# Altium project MONO65_A2_Project.PrjPcb (part 1 of 2)
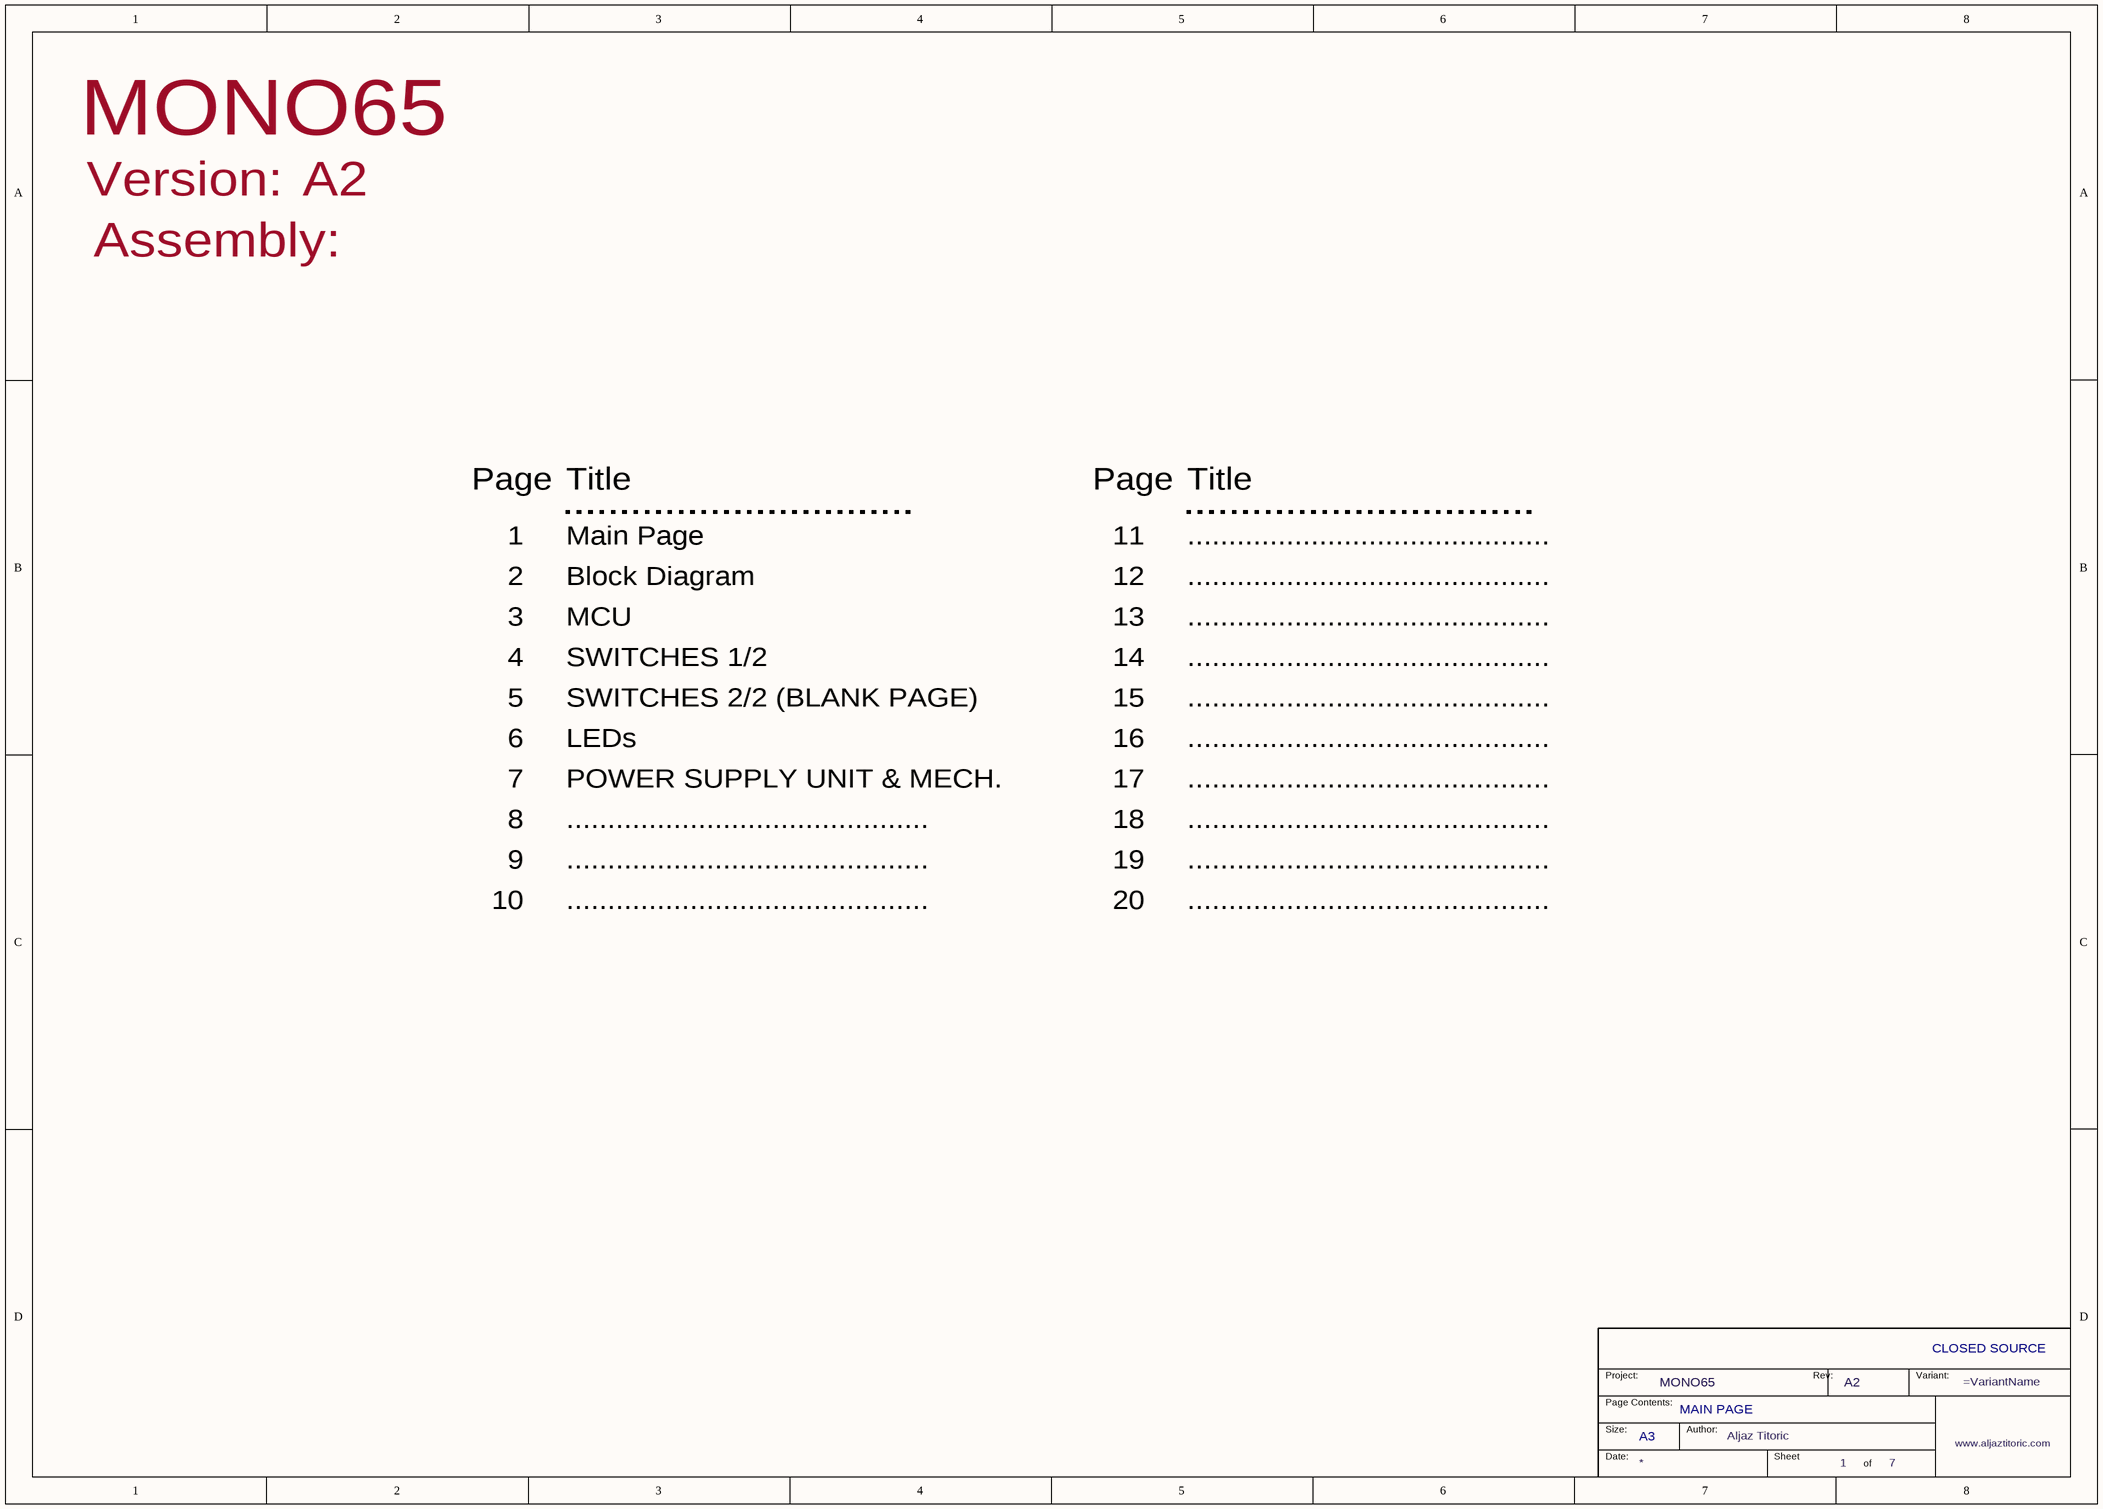
[diagram p0: MONO65_A2_s01 [Main page].SchDoc]
VersionRevision: A2; Project: MONO65; DesignedByURL: www.aljaztitoric.com; DesignedBy: Aljaz Titoric
7 sheets, 281 parts. Net scope: global (net labels, ports and power ports of the same name join across sheets).
Board file: MONO65_A2.PcbDoc
Sheets:
  MONO65_A2_s01 [Main page].SchDoc
  MONO65_A2_s02 [Block diagram].SchDoc
  MONO65_A2_s03 [MCU].SchDoc
  MONO65_A2_s04 [Switches-1].SchDoc
  MONO65_A2_s05 [Switches-2].SchDoc
  MONO65_A2_s06 [LEDs].SchDoc
  MONO65_A2_s07 [PSU].SchDoc

## Sheet MONO65_A2_s01 [Main page].SchDoc
size A3; DocumentNumber: 1; SheetNumber: 1; SheetTotal: 7

### Parts
TB*  PageContents: MAIN PAGE  Licence: CLOSED SOURCE  Size: A3  (hidden comment: TBL TitleBlock 01)  (graphical)

### Notes on the sheet
- Version:
- Assembly:
- Page
- Title
- 1
- 2
- Main Page
- Block Diagram
- 11
- 12
- ............................................
- 3
- MCU
- 13
- 4
- 5
- SWITCHES 1/2
- SWITCHES 2/2 (BLANK PAGE)
- 14
- 15
- 6
- LEDs
- 16
- 7
- 8
- POWER SUPPLY UNIT & MECH.
- 17
- 18
- 9
- 10
- 19
- 20
- (in symbol TBL TitleBlock 01) Project:; Rev:; Variant:; Page Contents:; Size:; Author:; Date:; Sheet; of

### Library data of the parts
TB* = TBL TitleBlock 01: Custom Title block

## Sheet MONO65_A2_s02 [Block diagram].SchDoc
size A3; DocumentNumber: 2; SheetNumber: 2; SheetTotal: 7
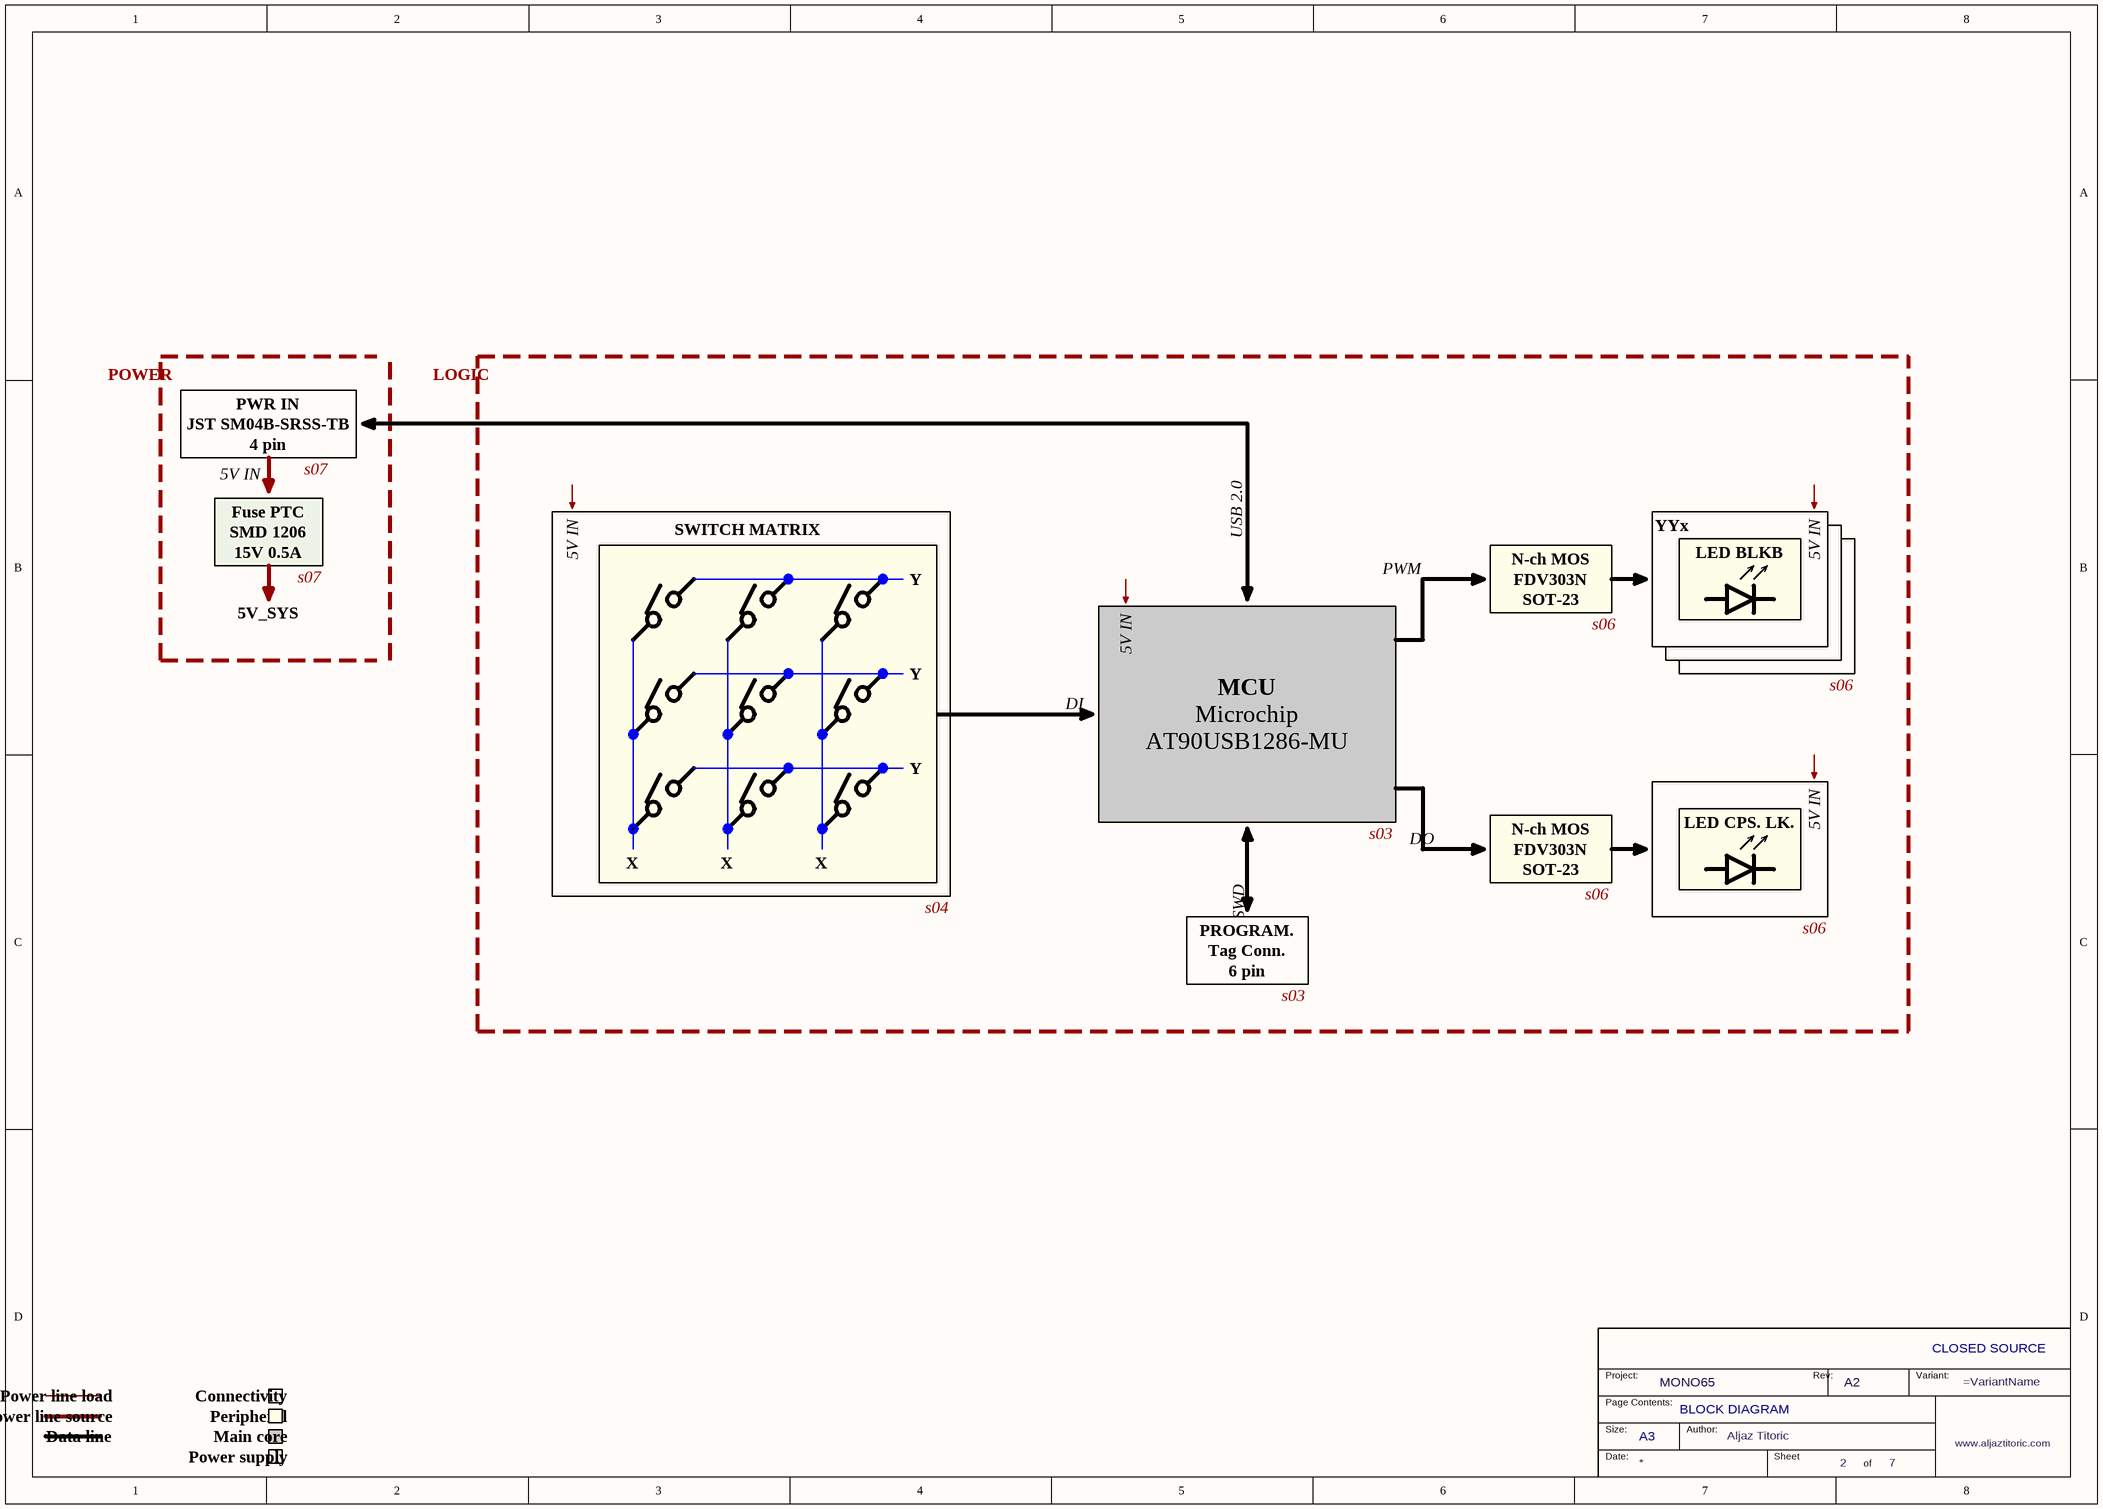
[diagram p1: MONO65_A2_s02 [Block diagram].SchDoc]

### Parts
(Parts that share a designator on the sheet are numbered #1, #2 ... from top to bottom, then left to right.)
TB*?#1  PageContents: BLOCK DIAGRAM  Licence: CLOSED SOURCE  Size: A3  (hidden comment: TBL TitleBlock 01)  (graphical)

### Notes on the sheet
- POWER
- LOGIC
- 4 pin
- JST SM04B-SRSS-TB
- PWR IN
- s07
- 5V IN
- Fuse PTC
- SWITCH MATRIX
- SMD 1206
- 15V 0.5A
- Y
- USB 2.0
- PWM
- FDV303N
- N-ch MOS
- YYx
- LED BLKB
- 5V_SYS
- SOT-23
- s06
- DI
- MCU
- Microchip
- AT90USB1286-MU
- X
- s03
- DO
- LED CPS. LK.
- s04
- SWD
- 6 pin
- Tag Conn.
- PROGRAM.
- Power line load
- Connectivity
- Data line
- Power line source
- Peripheral
- Main core
- Power supply
- (in symbol TBL TitleBlock 01) Project:; Rev:; Variant:; Page Contents:; Size:; Author:; Date:; Sheet; of

### Library data of the parts
TB*?#1 = TBL TitleBlock 01: Custom Title block

## Sheet MONO65_A2_s03 [MCU].SchDoc
size A3; DocumentNumber: 3; SheetNumber: 3; SheetTotal: 7
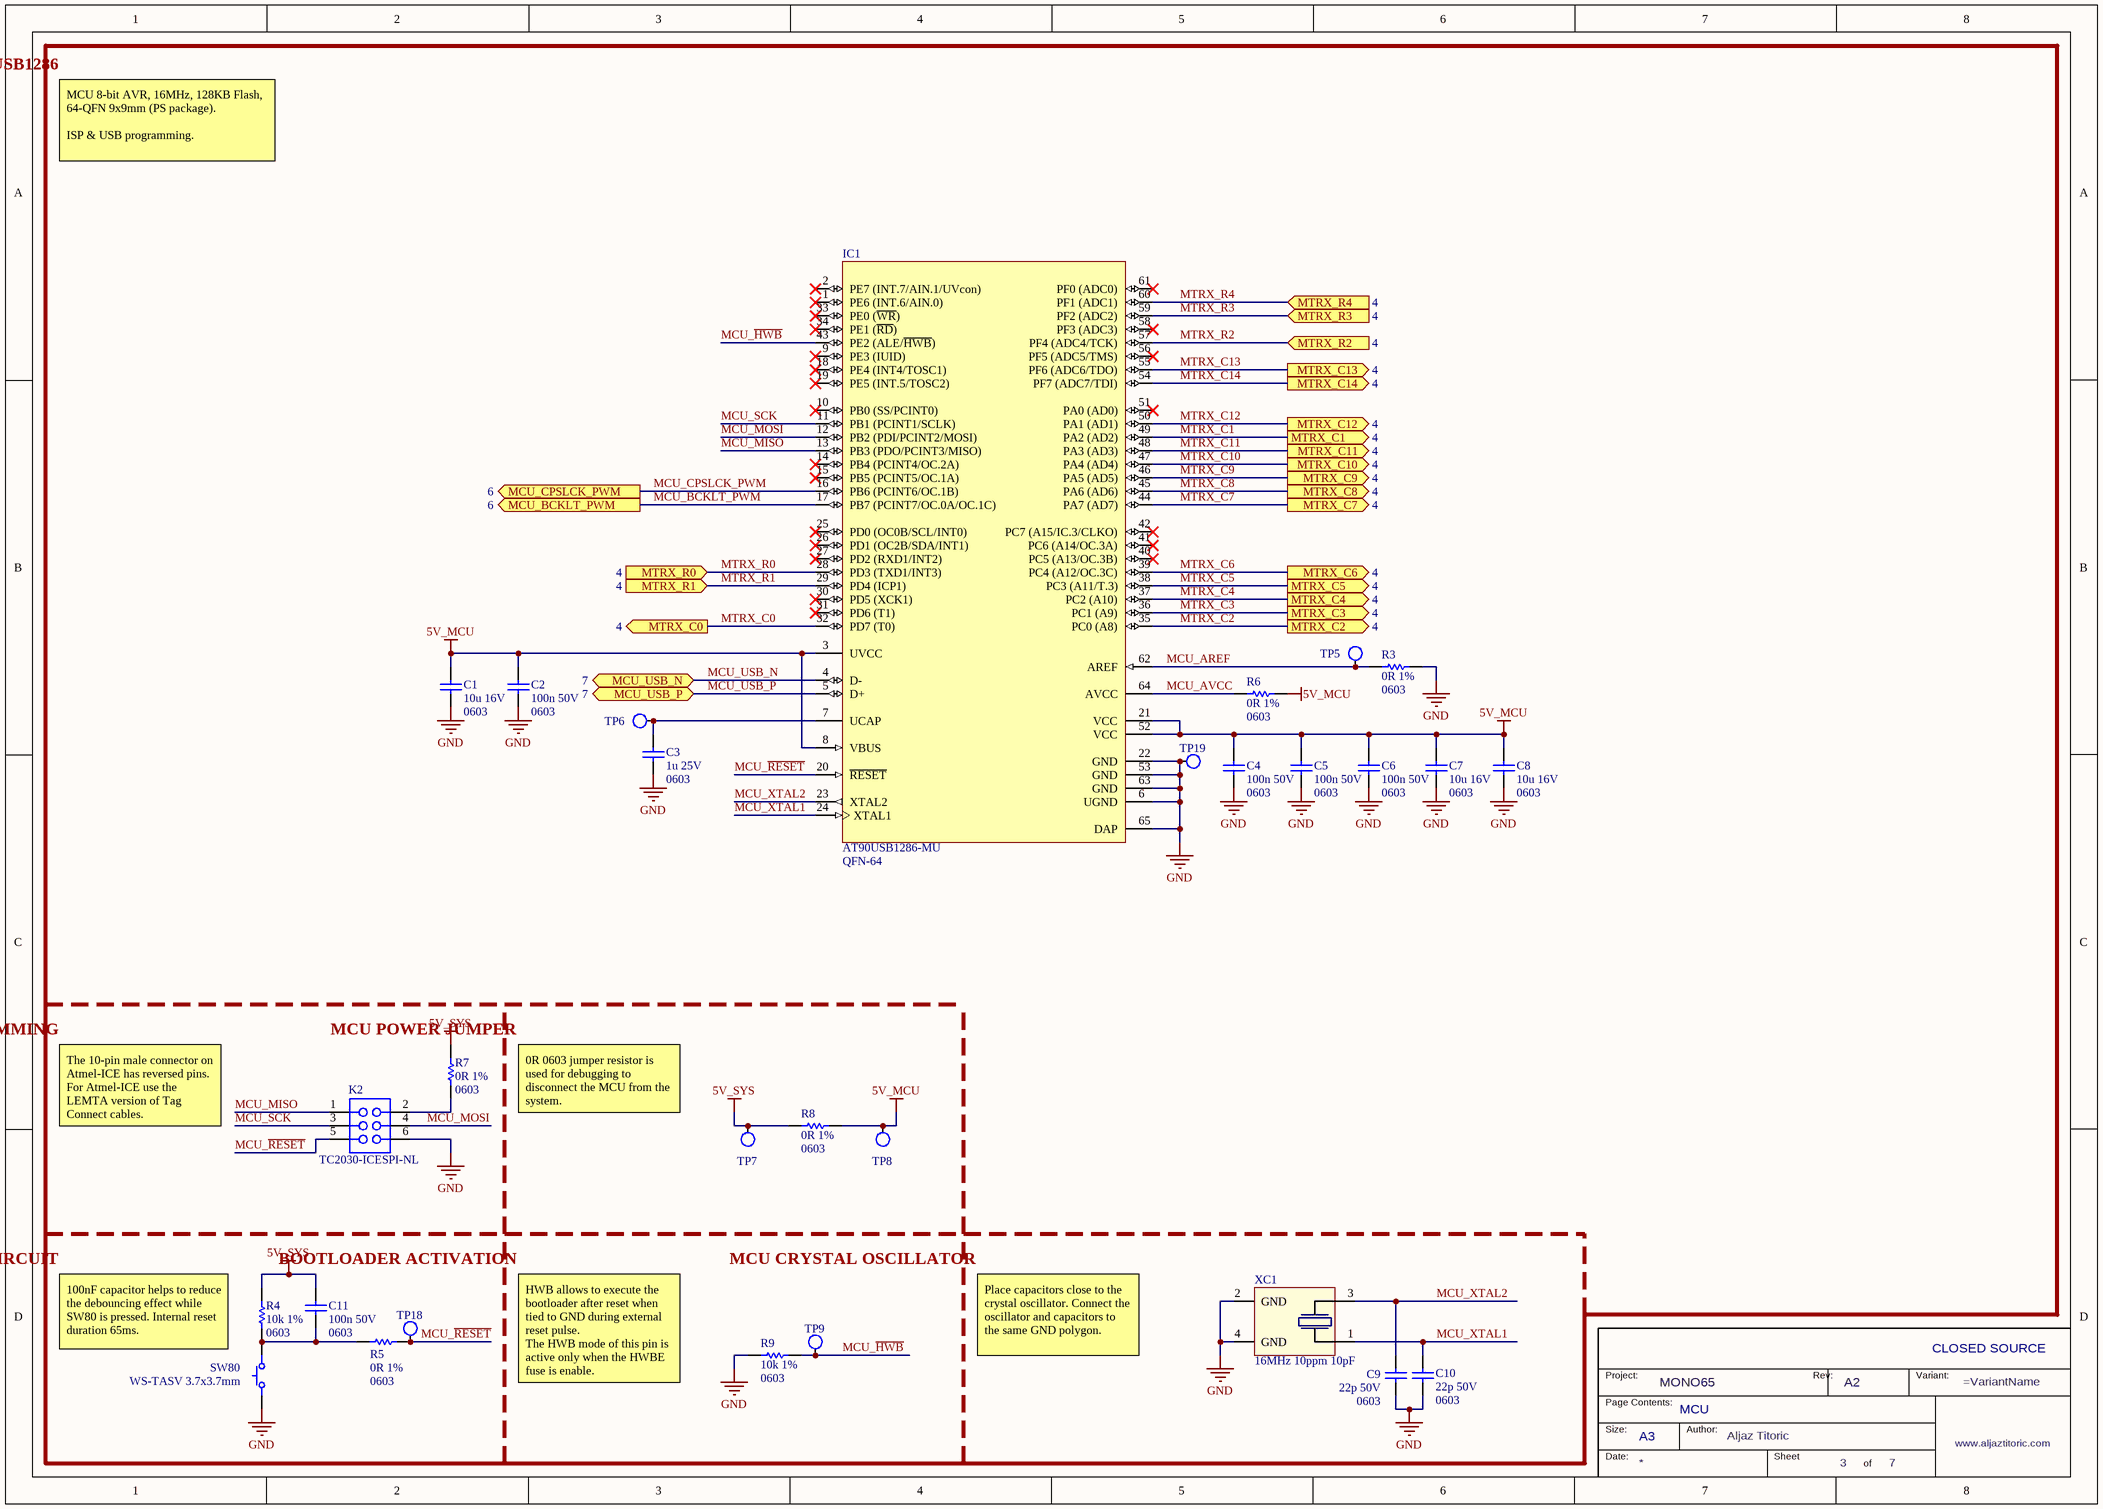
[diagram p2: MONO65_A2_s03 [MCU].SchDoc]

### Parts
(Parts that share a designator on the sheet are numbered #1, #2 ... from top to bottom, then left to right.)
C1  10u 16V  Case/Package: 0603  [CAPC1608X08N]
C2  100n 50V  Case/Package: 0603  [CAPC1608X08N]
C3  1u 25V  Case/Package: 0603  [CAPC1608X08N]
C4  100n 50V  Case/Package: 0603  [CAPC1608X08N]
C5  100n 50V  Case/Package: 0603  [CAPC1608X08N]
C6  100n 50V  Case/Package: 0603  [CAPC1608X08N]
C7  10u 16V  Case/Package: 0603  [CAPC1608X08N]
C8  10u 16V  Case/Package: 0603  [CAPC1608X08N]
C9  22p 50V  Case/Package: 0603  [CAPC1608X08N]
C10  22p 50V  Case/Package: 0603  [CAPC1608X08N]
C11  100n 50V  Case/Package: 0603  [CAPC1608X08N]
IC1  AT90USB1286-MU  Case/Package: QFN-64  [QFN50P900X900X100_HS-65N]
K2  TC2030-ICESPI-NL  [TC2030-6pin-NL]  (no BOM)
R3  0R 1%  Case/Package: 0603  [RESC1608X04N]
R4  10k 1%  Case/Package: 0603  [RESC1608X04N]
R5  0R 1%  Case/Package: 0603  [RESC1608X04N]
R6  0R 1%  Case/Package: 0603  [RESC1608X04N]
R7  0R 1%  Case/Package: 0603  [RESC1608X04N]
R8  0R 1%  Case/Package: 0603  [RESC1608X04N]
R9  10k 1%  Case/Package: 0603  [RESC1608X04N]
SW80  WS-TASV 3.7x3.7mm  [SWC WS-TASV J-Bend 3.7x3.7mm]
TB*?#2  PageContents: MCU  Licence: CLOSED SOURCE  Size: A3  (hidden comment: TBL TitleBlock 01)  (graphical)
TP5  TP SMD 0.6mm  [TP SMD 0.6mm]  (value not drawn)  (no BOM)
TP6  TP SMD 0.6mm  [TP SMD 0.6mm]  (value not drawn)  (no BOM)
TP7  TP SMD 0.6mm  [TP SMD 0.6mm]  (value not drawn)  (no BOM)
TP8  TP SMD 0.6mm  [TP SMD 0.6mm]  (value not drawn)  (no BOM)
TP9  TP SMD 0.6mm  [TP SMD 0.6mm]  (value not drawn)  (no BOM)
TP18  TP SMD 0.6mm  [TP SMD 0.6mm]  (value not drawn)  (no BOM)
TP19  TP SMD 0.6mm  [TP SMD 0.6mm]  (value not drawn)  (no BOM)
XC1  16MHz 10ppm 10pF  [Crystal Oscillator SMD 3225]

### Ports
MCU_BCKLT_PWM (out, see 6), MCU_CPSLCK_PWM (out, see 6), MCU_USB_N (bidir, see 7), MCU_USB_P (bidir, see 7), MTRX_C0 (out, see 4), MTRX_C1 (out, see 4), MTRX_C2 (out, see 4), MTRX_C3 (out, see 4), MTRX_C4 (out, see 4), MTRX_C5 (out, see 4), MTRX_C6 (out, see 4), MTRX_C7 (out, see 4), MTRX_C8 (out, see 4), MTRX_C9 (out, see 4), MTRX_C10 (out, see 4), MTRX_C11 (out, see 4), MTRX_C12 (out, see 4), MTRX_C13 (out, see 4), MTRX_C14 (out, see 4), MTRX_R0 (in, see 4), MTRX_R1 (in, see 4), MTRX_R2 (in, see 4), MTRX_R3 (in, see 4), MTRX_R4 (in, see 4)

### Nets
5V_MCU: C1.1 C2.1 C4.1 C5.1 C6.1 C7.1 C8.1 IC1.3(UVCC) IC1.8(VBUS) IC1.21(VCC) IC1.52(VCC) R6.2 R8.2 TP8.1
5V_SYS: C11.1 R4.1 R7.1 R8.1 TP7.1
GND: C1.2 C2.2 C3.2 C4.2 C5.2 C6.2 C7.2 C8.2 C9.2 C10.2 IC1.6(UGND) IC1.22(GND) IC1.53(GND) IC1.63(GND) IC1.65(DAP) K2.6 R3.2 R9.1 SW80.2 TP19.1 XC1.2(GND) XC1.4(GND)
MCU_AREF: IC1.62(AREF) R3.1 TP5.1
MCU_AVCC: IC1.64(AVCC) R6.1
MCU_BCKLT_PWM: IC1.17(PB7_(PCINT7/OC.0A/OC.1C)) ; port MCU_BCKLT_PWM
MCU_CPSLCK_PWM: IC1.16(PB6_(PCINT6/OC.1B)) ; port MCU_CPSLCK_PWM
MCU_~{HWB}: IC1.43(PE2_(ALE/~{HWB})) R9.2 TP9.1
MCU_MISO: IC1.13(PB3_(PDO/PCINT3/MISO)) K2.1
MCU_MOSI: IC1.12(PB2_(PDI/PCINT2/MOSI)) K2.4
MCU_~{RESET}: IC1.20(~{RESET}) K2.5 R5.2 TP18.1
MCU_SCK: IC1.11(PB1_(PCINT1/SCLK)) K2.3
MCU_USB_N: IC1.4(D-) ; port MCU_USB_N
MCU_USB_P: IC1.5(D+) ; port MCU_USB_P
MCU_XTAL1: C10.1 IC1.24(XTAL1) XC1.1
MCU_XTAL2: C9.1 IC1.23(XTAL2) XC1.3
MTRX_C0: IC1.32(PD7_(T0)) ; port MTRX_C0
MTRX_C1: IC1.49(PA2_(AD2)) ; port MTRX_C1
MTRX_C2: IC1.35(PC0_(A8)) ; port MTRX_C2
MTRX_C3: IC1.36(PC1_(A9)) ; port MTRX_C3
MTRX_C4: IC1.37(PC2_(A10)) ; port MTRX_C4
MTRX_C5: IC1.38(PC3_(A11/T.3)) ; port MTRX_C5
MTRX_C6: IC1.39(PC4_(A12/OC.3C)) ; port MTRX_C6
MTRX_C7: IC1.44(PA7_(AD7)) ; port MTRX_C7
MTRX_C8: IC1.45(PA6_(AD6)) ; port MTRX_C8
MTRX_C9: IC1.46(PA5_(AD5)) ; port MTRX_C9
MTRX_C10: IC1.47(PA4_(AD4)) ; port MTRX_C10
MTRX_C11: IC1.48(PA3_(AD3)) ; port MTRX_C11
MTRX_C12: IC1.50(PA1_(AD1)) ; port MTRX_C12
MTRX_C13: IC1.55(PF6_(ADC6/TDO)) ; port MTRX_C13
MTRX_C14: IC1.54(PF7_(ADC7/TDI)) ; port MTRX_C14
MTRX_R0: IC1.28(PD3_(TXD1/INT3)) ; port MTRX_R0
MTRX_R1: IC1.29(PD4_(ICP1)) ; port MTRX_R1
MTRX_R2: IC1.57(PF4_(ADC4/TCK)) ; port MTRX_R2
MTRX_R3: IC1.59(PF2_(ADC2)) ; port MTRX_R3
MTRX_R4: IC1.60(PF1_(ADC1)) ; port MTRX_R4
NetC3_1: C3.1 IC1.7(UCAP) TP6.1
NetC11_2: C11.2 R4.2 R5.1 SW80.1
NetK2_2: K2.2 R7.2

Not connected (* = marked no-connect by the designer): IC1 1(PE6_(INT.6/AIN.0))* 2(PE7_(INT.7/AIN.1/UVcon))* 9(PE3_(IUID))* 10(PB0_(SS/PCINT0))* 14(PB4_(PCINT4/OC.2A))* 15(PB5_(PCINT5/OC.1A))* 18(PE4_(INT4/TOSC1))* 19(PE5_(INT.5/TOSC2))* 25(PD0_(OC0B/SCL/INT0))* 26(PD1_(OC2B/SDA/INT1))* 27(PD2_(RXD1/INT2))* 30(PD5_(XCK1))* 31(PD6_(T1))* 33(PE0_(~{WR}))* 34(PE1_(~{RD}))* 40(PC5_(A13/OC.3B))* 41(PC6_(A14/OC.3A))* 42(PC7_(A15/IC.3/CLKO))* 51(PA0_(AD0))* 56(PF5_(ADC5/TMS))* 58(PF3_(ADC3))* 61(PF0_(ADC0))*

### Notes on the sheet
- MCU AT90USB1286
- MCU 8-bit AVR, 16MHz, 128KB Flash, 64-QFN 9x9mm (PS package).
  ISP & USB programming.
- ISP (SPI) PROGRAMMING
- MCU POWER JUMPER
- The 10-pin male connector on Atmel-ICE has reversed pins. For Atmel-ICE use the LEMTA version of Tag Connect cables.
- 0R 0603 jumper resistor is used for debugging to disconnect the MCU from the system.
- MCU RESET CIRCUIT
- BOOTLOADER ACTIVATION
- MCU CRYSTAL OSCILLATOR
- 100nF capacitor helps to reduce the debouncing effect while SW80 is pressed. Internal reset duration 65ms.
- HWB allows to execute the bootloader after reset when tied to GND during external
  reset pulse.
  The HWB mode of this pin is active only when the HWBE fuse is enable.
- Place capacitors close to the crystal oscillator. Connect the oscillator and capacitors to the same GND polygon.
- (in symbol TBL TitleBlock 01) Project:; Rev:; Variant:; Page Contents:; Size:; Author:; Date:; Sheet; of

### Library data of the parts
C1 C7 C8 = CAP SMD CER 10u 16V X5R 0603: SMD CAPACITOR,10u, 16V, X5R, 0603; Manufacturer: Murata; Manufacturer Part Number: GRM188R61C106MA73D; Capacitance: 10uF; Tolerance: 20%; Supplier 1: Digi-Key; Stock 1: 24451; Pricing 1: 1 = 0,31000, 10 = 0,21500, 50 = 0,14340, 100 = 0,12190, 500 = 0,08604, 1000 = 0,07528 (USD); RoHS: Yes; Mount: Surface Mount; Case Code (Metric): 1608; Case Code (Imperial): 0603; Min Operating Temperature: -55°C; Max Operating Temperature: 85°C; Package Quantity: 4000; Packaging: Tape and Reel; Voltage Rating: 16V; Dielectric: X5R; Voltage: 16V; Voltage Rating (DC): 16V; Series: GRM; Length: 1.6mm; Width: 0.031inch; Height: 0.8mm; Thickness: 0.031inch; Depth: 0.8mm; REACH SVHC: No SVHC; Lead Free: Lead Free; RoHS Compliant: Yes; ComponentLink1URL: https://datasheet.ciiva.com/46444/1769893-46444981.pdf?src-supplier=Element14; ComponentLink1Description: https://datasheet.ciiva.com/46444/1769893-46444981.pdf?src-supplier=Element14; ComponentLink2URL: https://datasheet.ciiva.com/14906/partnumbering-e-01-14906479.pdf?src-supplier=Digi-Key; ComponentLink2Description: https://datasheet.ciiva.com/14906/partnumbering-e-01-14906479.pdf?src-supplier=Digi-Key; Supplier Part Number 1: 490-7201-1-ND
C2 C4-C6 C11 = CAP SMD CER 100n 50V X7R 0603: SMD CAPACITOR, 100n, 50V, X7R, 0603; Manufacturer: TDK; Manufacturer Part Number: CGA3E2X7R1H104K080AA; Capacitance: 100nF; Tolerance: 10%; Supplier 1: Digi-Key; Stock 1: 8773520; Pricing 1: 1 = 0,11000, 10 = 0,07900, 100 = 0,03510, 500 = 0,02510, 1000 = 0,01972 (USD); RoHS: Yes; Mount: Surface Mount; Weight: 7.1E-05oz; Case Code (Imperial): 0603; Case Code (Metric): 1608; Min Operating Temperature: -55°C; Max Operating Temperature: 125°C; Packaging: Tape and Reel; Voltage Rating: 50V; Dielectric: X7R; Package Quantity: 1; Termination: SMD/SMT; Voltage Rating (DC): 50V; Voltage: 50V; Composition: Ceramic; Length: 1.6mm; Height: 0.8mm; Width: 0.8mm; Thickness: 0.035inch; Depth: 0.8mm; Ratings: AEC-Q200; Radiation Hardening: No; REACH SVHC: No SVHC; Lead Free: Lead Free; ComponentLink1URL: https://datasheet.ciiva.com/24216/cga3e2x7r1h104k080aa-266291-24216208.pdf?src-supplier=Mouser; ComponentLink1Description: https://datasheet.ciiva.com/24216/cga3e2x7r1h104k080aa-266291-24216208.pdf?src-supplier=Mouser; ComponentLink2URL: https://datasheet.ciiva.com/15192/getdatasheetpartid-715867-15192412.pdf?src-supplier=Verical; ComponentLink2Description: https://datasheet.ciiva.com/15192/getdatasheetpartid-715867-15192412.pdf?src-supplier=Verical; ComponentLink3URL: https://datasheet.ciiva.com/16500/mlccspec-automotive-general-midvoltage-en-16500693.pdf?src-supplier=Future+Electronics; ComponentLink3Description: https://datasheet.ciiva.com/16500/mlccspec-automotive-general-midvoltage-en-16500693.pdf?src-supplier=Future+Electronics; ComponentLink4URL: https://datasheet.ciiva.com/22725/1735392-22725642.pdf?src-supplier=Element14; ComponentLink4Description: https://datasheet.ciiva.com/22725/1735392-22725642.pdf?src-supplier=Element14; ComponentLink5URL: https://datasheet.ciiva.com/23803/1936565-23803084.pdf?src-supplier=Newark; ComponentLink5Description: https://datasheet.ciiva.com/23803/1936565-23803084.pdf?src-supplier=Newark; ComponentLink6URL: https://datasheet.ciiva.com/46385/1735392-46385708.pdf?src-supplier=Element14; ComponentLink6Description: https://datasheet.ciiva.com/46385/1735392-46385708.pdf?src-supplier=Element14; Supplier Part Number 1: 445-5666-1-ND
C3 = CAP SMD CER 1u 25V X7R 0603: SMD CAPACITOR, 1µF, 25V, X7R, 0603; Manufacturer: KEMET; Manufacturer Part Number: C0603C105K3RACTU; Dielectric Material: Ceramic; Capacitance: 1uF; Tolerance: 10%; Dissipation Factor: 5%; Supplier 1: Digi-Key; Stock 1: 271609; Pricing 1: 1 = 0,30000, 10 = 0,20900, 100 = 0,11830, 500 = 0,08350, 1000 = 0,07307 (USD); RoHS: Yes; Mount: Surface Mount; Case Code (Metric): 1608; Case Code (Imperial): 0603; Min Operating Temperature: -55°C; Max Operating Temperature: 125°C; Voltage Rating: 25V; Packaging: Tape and Reel; Dielectric: X7R; Voltage Rating (DC): 25V; Package Quantity: 1; Termination: SMD/SMT; Voltage: 25V; Length: 1.6mm; Height: 0.8mm; Width: 0.031inch; Thickness: 0.034inch; Depth: 0.8mm; REACH SVHC: No SVHC; ComponentLink1URL: https://datasheet.ciiva.com/7823/1851736-7823596.pdf?src-supplier=Element14; ComponentLink1Description: https://datasheet.ciiva.com/7823/1851736-7823596.pdf?src-supplier=Element14; Supplier Part Number 1: 399-7376-1-ND
C9 C10 = CAP SMD CER 22p 50V NP0 0603: SMD CAPACITOR, 22p, 50V, C0G/NP0, 0603; Manufacturer: Kyocera AVX; Manufacturer Part Number: 06035A220JAT2A; Dielectric Material: Ceramic; Capacitance: 22pF; Tolerance: 5%; Dielectric: C0G; Insulation Resistance: 100GR; Temperature Coefficient: 30ppm/°C; Supplier 1: Digi-Key; Stock 1: 1291683; Pricing 1: 1 = 0,10000, 10 = 0,05600, 50 = 0,03040, 100 = 0,02480, 500 = 0,01772, 1000 = 0,01392 (USD); RoHS: Yes; Mount: Surface Mount,PCB; Number of Pins: 2; Case Code (Imperial): 0603; Case Code (Metric): 1608; Contact Plating: Tin,Matte; Min Operating Temperature: -55°C; Max Operating Temperature: 125°C; Packaging: Tape and Reel; Voltage Rating: 50V; Voltage Rating (DC): 50V; Termination: SMD/SMT; Voltage: 50V; Package Quantity: 1; Length: 1.6mm; Width: 0.81mm; Height: 0.63mm; Thickness: 0.035inch; Depth: 0.81mm; Radiation Hardening: No; REACH SVHC: No SVHC; RoHS Compliant: Yes; Lead Free: Lead Free; ComponentLink1URL: https://datasheet.ciiva.com/11788/0900766b802d4697-11788031.pdf?src-supplier=RSComponents; ComponentLink1Description: https://datasheet.ciiva.com/11788/0900766b802d4697-11788031.pdf?src-supplier=RSComponents; ComponentLink2URL: https://datasheet.ciiva.com/16351/ccog-16351125.pdf?src-supplier=Future+Electronics; ComponentLink2Description: https://datasheet.ciiva.com/16351/ccog-16351125.pdf?src-supplier=Future+Electronics; ComponentLink3URL: https://datasheet.ciiva.com/7855/759117-7855064.pdf?src-supplier=Element14; ComponentLink3Description: https://datasheet.ciiva.com/7855/759117-7855064.pdf?src-supplier=Element14; ComponentLink4URL: https://datasheet.ciiva.com/150/ccog-150366.pdf?src-supplier=Digi-Key; ComponentLink4Description: https://datasheet.ciiva.com/150/ccog-150366.pdf?src-supplier=Digi-Key; ComponentLink5URL: https://datasheet.ciiva.com/150/ccog-150367.pdf?src-supplier=Digi-Key; ComponentLink5Description: https://datasheet.ciiva.com/150/ccog-150367.pdf?src-supplier=Digi-Key; ComponentLink6URL: https://datasheet.ciiva.com/1124/759117-1124728.pdf?src-supplier=Element14; ComponentLink6Description: https://datasheet.ciiva.com/1124/759117-1124728.pdf?src-supplier=Element14; Supplier Part Number 1: 478-1167-1-ND
IC1 = MCU AT90USB1286-MU: MCU 8-bit AVR, 16MHz, 128KB Flash, 64-QFN 9x9mm (PS package); Manufacturer: Microchip / Atmel; Interface: SPI,Serial,USB,USART,2-Wire,I2C,UART,EBI/EMI; RAM Size: 8KB; Max Supply Voltage: 5.5V; Min Supply Voltage: 2.7V; Number of ADC Channels: 8; Number of PWM Channels: 10; Number of Timers/Counters: 4; Number of I/Os: 48; Data Bus Width: 8b; Max Frequency: 20MHz; Number of SPI Channels: 1; Oscillator Type: Internal; Watchdog Timer: Yes; Peripherals: POR,PWM,WDT,Brown-out Detect/Reset; Supplier 1: RSComponents; Manufacturer Part Number: AT90USB1286-MU; Stock 1: 0; RoHS: Yes; Mount: Surface Mount; Number of Pins: 64; Min Operating Temperature: -40°C; Max Operating Temperature: 85°C; Frequency: 16MHz; Packaging: Tray; Package Quantity: 1300; Number of Programmable I/O: 48; Number of I2C Channels: 1; Address Bus Width: 8b; Memory Type: FLASH; Memory Size: 128KB; Core Architecture: AVR; Series: AVR®; Length: 9mm; Width: 9mm; Height: 1mm; Radiation Hardening: No; REACH SVHC: No SVHC; Lead Free: Lead Free; RoHS Compliant: Yes; ComponentLink1URL: https://datasheet.ciiva.com/26927/getdatasheetpartid-364802-26927386.pdf?src-supplier=Verical; ComponentLink1Description: https://datasheet.ciiva.com/26927/getdatasheetpartid-364802-26927386.pdf?src-supplier=Verical; ComponentLink2URL: https://datasheet.ciiva.com/1651/doc7593-1651388.pdf?src-supplier=Digi-Key; ComponentLink2Description: https://datasheet.ciiva.com/1651/doc7593-1651388.pdf?src-supplier=Digi-Key; ComponentLink3URL: https://datasheet.ciiva.com/14132/at90usb646-7-1286-7-eng-tds-14132493.pdf?src-supplier=Distrelec; ComponentLink3Description: https://datasheet.ciiva.com/14132/at90usb646-7-1286-7-eng-tds-14132493.pdf?src-supplier=Distrelec; Supplier Part Number 1: 1278162
K2 = CON B2W HYB TC2030-ICESPI-NL-LEMTA: TC2030-ICESPI-NL-LEMTA 6-Pin “No Legs” PCB points for 10-pin micro-connector for AVR processors. LEMTA = reversed pins. Suitable for Atmel ICE.
R3 R5-R8 = RES SMD 0R 1% 0603: SMD RESISTOR 0R 1% 0603 0.1W; Manufacturer: Yageo; Manufacturer Part Number: RC0603JR-070RL; Resistance: 0mR; Power Rating: 100mW; Voltage Rating: 50V; Temperature Coefficient: 200ppm/°C; Supplier 1: Digi-Key; Stock 1: 22182575; Pricing 1: 1 = 0,10000, 10 = 0,01900, 25 = 0,01360, 50 = 0,01040, 100 = 0,00770, 250 = 0,00588, 500 = 0,00472, 1000 = 0,00347 (USD); RoHS: Yes; Number of Pins: 2; Case Code (Imperial): 0603; Case Code (Metric): 1608; Contact Plating: Tin,Matte; Min Operating Temperature: -55°C; Max Operating Temperature: 155°C; Packaging: Tape and Reel; Voltage Rating (DC): 50V; Composition: Thick Film; Tolerance: 1%; Military Standard: Not; Package Quantity: 5000; Termination: SMD/SMT; Length: 1.6mm; Height: 0.45mm; Width: 0.8mm; Depth: 0.8mm; Radiation Hardening: No; REACH SVHC: No SVHC; Lead Free: Lead Free; ComponentLink1URL: https://datasheet.ciiva.com/11808/pyu-r-int-6-11808700.pdf?src-supplier=RSComponents; ComponentLink1Description: https://datasheet.ciiva.com/11808/pyu-r-int-6-11808700.pdf?src-supplier=RSComponents; ComponentLink2URL: https://datasheet.ciiva.com/7746/1738695-7746421.pdf?src-supplier=Element14; ComponentLink2Description: https://datasheet.ciiva.com/7746/1738695-7746421.pdf?src-supplier=Element14; ComponentLink3URL: https://datasheet.ciiva.com/8883/pyu-rc0603-51-rohs-l-4-8883045.pdf?src-supplier=Avnet; ComponentLink3Description: https://datasheet.ciiva.com/8883/pyu-rc0603-51-rohs-l-4-8883045.pdf?src-supplier=Avnet; ComponentLink4URL: https://datasheet.ciiva.com/15189/getdatasheetpartid-329462-15189845.pdf?src-supplier=Verical; ComponentLink4Description: https://datasheet.ciiva.com/15189/getdatasheetpartid-329462-15189845.pdf?src-supplier=Verical; ComponentLink5URL: https://datasheet.ciiva.com/7746/1738695-7746422.pdf?src-supplier=Element14; ComponentLink5Description: https://datasheet.ciiva.com/7746/1738695-7746422.pdf?src-supplier=Element14; ComponentLink6URL: https://datasheet.ciiva.com/12555/rc0603-272842-12555254.pdf?src-supplier=Mouser; ComponentLink6Description: https://datasheet.ciiva.com/12555/rc0603-272842-12555254.pdf?src-supplier=Mouser; ComponentLink7URL: https://datasheet.ciiva.com/22747/443971-22747530.pdf?src-supplier=Element14; ComponentLink7Description: https://datasheet.ciiva.com/22747/443971-22747530.pdf?src-supplier=Element14; Supplier Part Number 1: 311-0.0GRDKR-ND
R4 R9 = RES SMD 10k 1% 0603: SMD RESISTOR 10k 1% 0603 0.1W; Manufacturer: Panasonic; Manufacturer Part Number: ERJ-3EKF1002V; Resistance: 10kR; Power Rating: 100mW; Temperature Coefficient: 100ppm/°C; Voltage Rating: 75V; Supplier 1: Digi-Key; Stock 1: 1973326; Pricing 1: 1 = 0,10000, 10 = 0,06000, 100 = 0,02440, 1000 = 0,01094, 2500 = 0,00950 (USD); RoHS: Yes; Mount: Surface Mount; Number of Pins: 2; Case Code (Metric): 1608; Case Code (Imperial): 0603; Contact Plating: Tin; Min Operating Temperature: -55°C; Max Operating Temperature: 155°C; Tolerance: 1%; Packaging: Tape and Reel; Composition: Thick Film; Termination: SMD/SMT; Package Quantity: 1; Max Power Dissipation: 100mW; Military Standard: Not; Number of Terminations: 2; Voltage Rating (DC): 75V; Features: Automotive AEC-Q200; Length: 1.6mm; Height: 0.45mm; Width: 0.031inch; Depth: 0.8mm; Radiation Hardening: No; Lead Free: Lead Free; REACH SVHC: No SVHC; ComponentLink1URL: https://datasheet.ciiva.com/7830/aoa0000ce2-7830729.pdf?src-supplier=Element14; ComponentLink1Description: https://datasheet.ciiva.com/7830/aoa0000ce2-7830729.pdf?src-supplier=Element14; ComponentLink2URL: https://datasheet.ciiva.com/17212/aoa0000ce2-17212105.pdf?src-supplier=Avnet+Europe; ComponentLink2Description: https://datasheet.ciiva.com/17212/aoa0000ce2-17212105.pdf?src-supplier=Avnet+Europe; ComponentLink3URL: https://datasheet.ciiva.com/48530/aoa0000ce2-48530988.pdf?src-supplier=Avnet; ComponentLink3Description: https://datasheet.ciiva.com/48530/aoa0000ce2-48530988.pdf?src-supplier=Avnet; ComponentLink4URL: https://datasheet.ciiva.com/24070/aoa0000ce2-24070318.pdf?src-supplier=Mouser; ComponentLink4Description: https://datasheet.ciiva.com/24070/aoa0000ce2-24070318.pdf?src-supplier=Mouser; ComponentLink5URL: https://datasheet.ciiva.com/16759/70260748-16759807.pdf?src-supplier=Allied+Electronics; ComponentLink5Description: https://datasheet.ciiva.com/16759/70260748-16759807.pdf?src-supplier=Allied+Electronics; ComponentLink6URL: https://datasheet.ciiva.com/16511/aoa0000ce2-16511861.pdf?src-supplier=Avnet+Asia; ComponentLink6Description: https://datasheet.ciiva.com/16511/aoa0000ce2-16511861.pdf?src-supplier=Avnet+Asia; ComponentLink7URL: https://datasheet.ciiva.com/46372/1678782-46372725.pdf?src-supplier=Element14; ComponentLink7Description: https://datasheet.ciiva.com/46372/1678782-46372725.pdf?src-supplier=Element14; ComponentLink8URL: https://datasheet.ciiva.com/28514/426256-28514198.pdf?src-supplier=Element14; ComponentLink8Description: https://datasheet.ciiva.com/28514/426256-28514198.pdf?src-supplier=Element14; ComponentLink9URL: https://datasheet.ciiva.com/9194/aoa0000ce2-9194199.pdf?src-supplier=Avnet; ComponentLink9Description: https://datasheet.ciiva.com/9194/aoa0000ce2-9194199.pdf?src-supplier=Avnet; ComponentLink10URL: https://datasheet.ciiva.com/30208/aoa0000ce2-30208985.pdf?src-supplier=Onlinecomponents.com; ComponentLink10Description: https://datasheet.ciiva.com/30208/aoa0000ce2-30208985.pdf?src-supplier=Onlinecomponents.com; Supplier Part Number 1: P10.0KHDKR-ND
SW80 = SWC 430173003816: WS-TASV J-Bend SMT Tact Switch 3.7x3.7mm. 12 V (DC) 50mA. 500000 Cycles.; Manufacturer: Wurth Electronics; Supplier 1: Mouser; Manufacturer Part Number: 430173003816; Stock 1: 9733; Pricing 1: 1 = 0,51000, 10 = 0,48600, 50 = 0,42000, 100 = 0,42000, 1000 = 0,36800, 10000 = 0,36800 (USD); RoHS: No; Supplier Part Number 1: 710-430173003816
TB*?#2 = TBL TitleBlock 01: Custom Title block
TP5-TP9 TP18 TP19 = TPT SMD 60: Test Point SMD 0.6mm
XC1 = CYR SMD 16MHz MCSJK-7U-16.00-10-10-80-B-10: Crystal Resonator, 16MHz, 10pF, 3.2mm X 2.5mm, SMD; Manufacturer: Multicomp; Supplier 1: Farnell; Manufacturer Part Number: MCSJK-7U-16.00-10-10-80-B-10; Stock 1: 69101; Pricing 1: 5 = 0,21300, 50 = 0,17300, 250 = 0,15200, 500 = 0,13800 (EUR); RoHS: No; Supplier Part Number 1: 2853934; Case/Package: SMD 3225

## Sheet MONO65_A2_s04 [Switches-1].SchDoc
size A3; DocumentNumber: 4; SheetNumber: 4; SheetTotal: 7
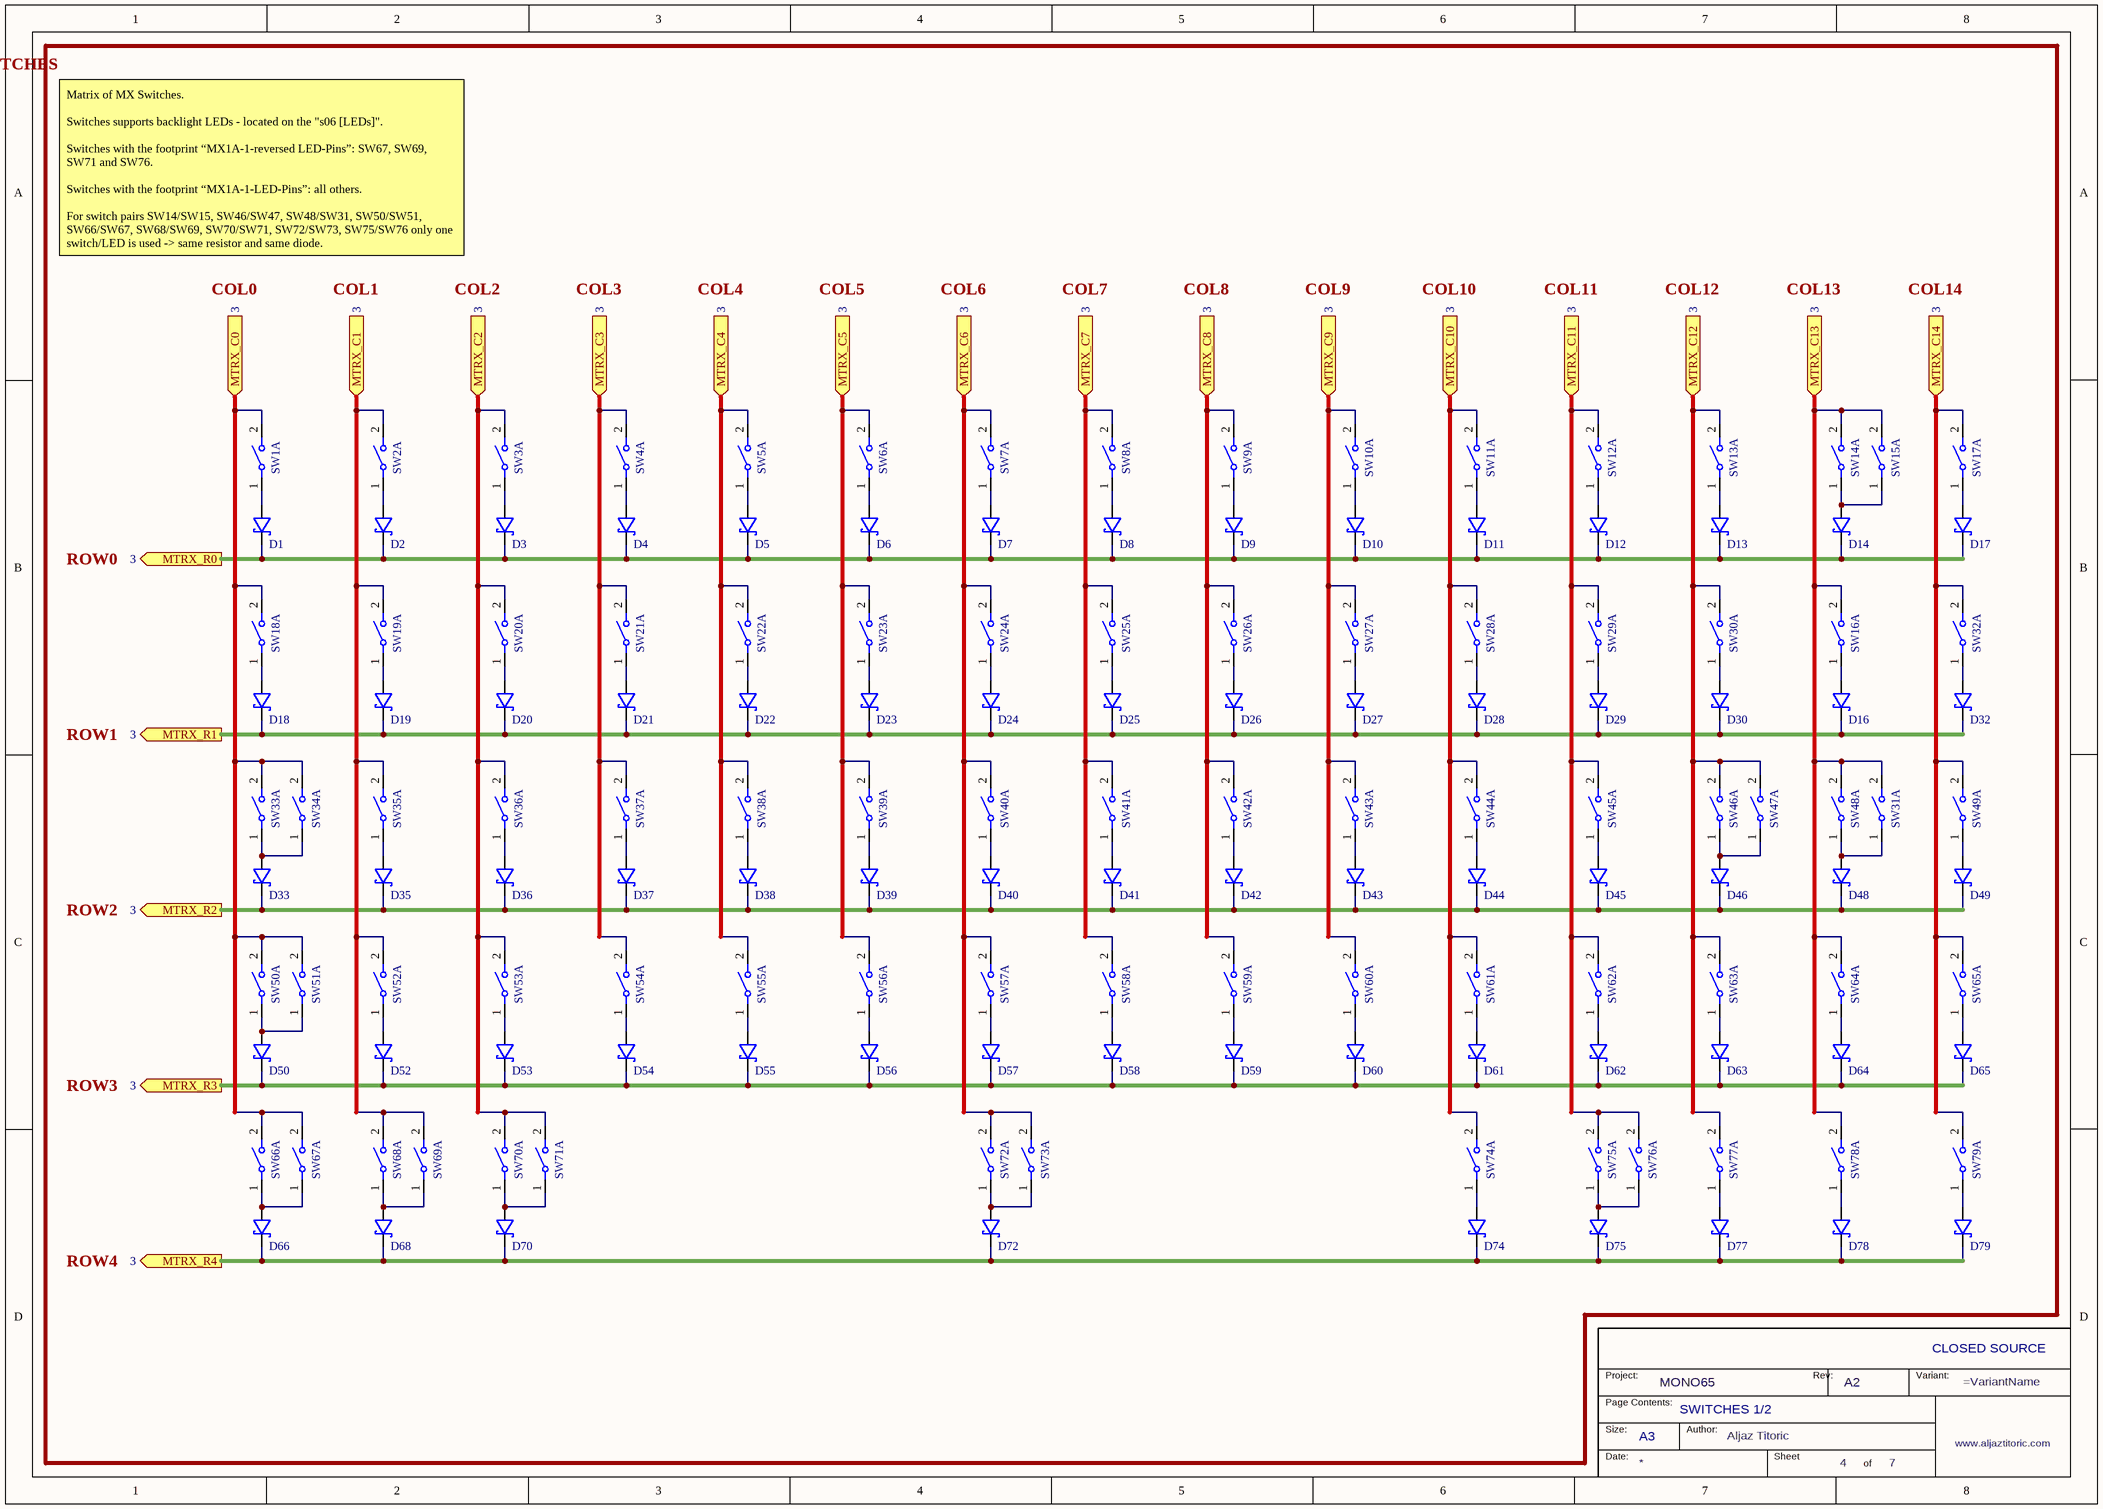
[diagram p3: MONO65_A2_s04 [Switches-1].SchDoc]

### Parts
(Parts that share a designator on the sheet are numbered #1, #2 ... from top to bottom, then left to right.)
D1  SD0805S040S0R5  [DIOC2012X06N - signal]  (value not drawn)
D2  SD0805S040S0R5  [DIOC2012X06N - signal]  (value not drawn)
D3  SD0805S040S0R5  [DIOC2012X06N - signal]  (value not drawn)
D4  SD0805S040S0R5  [DIOC2012X06N - signal]  (value not drawn)
D5  SD0805S040S0R5  [DIOC2012X06N - signal]  (value not drawn)
D6  SD0805S040S0R5  [DIOC2012X06N - signal]  (value not drawn)
D7  SD0805S040S0R5  [DIOC2012X06N - signal]  (value not drawn)
D8  SD0805S040S0R5  [DIOC2012X06N - signal]  (value not drawn)
D9  SD0805S040S0R5  [DIOC2012X06N - signal]  (value not drawn)
D10  SD0805S040S0R5  [DIOC2012X06N - signal]  (value not drawn)
D11  SD0805S040S0R5  [DIOC2012X06N - signal]  (value not drawn)
D12  SD0805S040S0R5  [DIOC2012X06N - signal]  (value not drawn)
D13  SD0805S040S0R5  [DIOC2012X06N - signal]  (value not drawn)
D14  SD0805S040S0R5  [DIOC2012X06N - signal]  (value not drawn)
D16  SD0805S040S0R5  [DIOC2012X06N - signal]  (value not drawn)
D17  SD0805S040S0R5  [DIOC2012X06N - signal]  (value not drawn)
D18  SD0805S040S0R5  [DIOC2012X06N - signal]  (value not drawn)
D19  SD0805S040S0R5  [DIOC2012X06N - signal]  (value not drawn)
D20  SD0805S040S0R5  [DIOC2012X06N - signal]  (value not drawn)
D21  SD0805S040S0R5  [DIOC2012X06N - signal]  (value not drawn)
D22  SD0805S040S0R5  [DIOC2012X06N - signal]  (value not drawn)
D23  SD0805S040S0R5  [DIOC2012X06N - signal]  (value not drawn)
D24  SD0805S040S0R5  [DIOC2012X06N - signal]  (value not drawn)
D25  SD0805S040S0R5  [DIOC2012X06N - signal]  (value not drawn)
D26  SD0805S040S0R5  [DIOC2012X06N - signal]  (value not drawn)
D27  SD0805S040S0R5  [DIOC2012X06N - signal]  (value not drawn)
D28  SD0805S040S0R5  [DIOC2012X06N - signal]  (value not drawn)
D29  SD0805S040S0R5  [DIOC2012X06N - signal]  (value not drawn)
D30  SD0805S040S0R5  [DIOC2012X06N - signal]  (value not drawn)
D32  SD0805S040S0R5  [DIOC2012X06N - signal]  (value not drawn)
D33  SD0805S040S0R5  [DIOC2012X06N - signal]  (value not drawn)
D35  SD0805S040S0R5  [DIOC2012X06N - signal]  (value not drawn)
D36  SD0805S040S0R5  [DIOC2012X06N - signal]  (value not drawn)
D37  SD0805S040S0R5  [DIOC2012X06N - signal]  (value not drawn)
D38  SD0805S040S0R5  [DIOC2012X06N - signal]  (value not drawn)
D39  SD0805S040S0R5  [DIOC2012X06N - signal]  (value not drawn)
D40  SD0805S040S0R5  [DIOC2012X06N - signal]  (value not drawn)
D41  SD0805S040S0R5  [DIOC2012X06N - signal]  (value not drawn)
D42  SD0805S040S0R5  [DIOC2012X06N - signal]  (value not drawn)
D43  SD0805S040S0R5  [DIOC2012X06N - signal]  (value not drawn)
D44  SD0805S040S0R5  [DIOC2012X06N - signal]  (value not drawn)
D45  SD0805S040S0R5  [DIOC2012X06N - signal]  (value not drawn)
D46  SD0805S040S0R5  [DIOC2012X06N - signal]  (value not drawn)
D48  SD0805S040S0R5  [DIOC2012X06N - signal]  (value not drawn)
D49  SD0805S040S0R5  [DIOC2012X06N - signal]  (value not drawn)
D50  SD0805S040S0R5  [DIOC2012X06N - signal]  (value not drawn)
D52  SD0805S040S0R5  [DIOC2012X06N - signal]  (value not drawn)
D53  SD0805S040S0R5  [DIOC2012X06N - signal]  (value not drawn)
D54  SD0805S040S0R5  [DIOC2012X06N - signal]  (value not drawn)
D55  SD0805S040S0R5  [DIOC2012X06N - signal]  (value not drawn)
D56  SD0805S040S0R5  [DIOC2012X06N - signal]  (value not drawn)
D57  SD0805S040S0R5  [DIOC2012X06N - signal]  (value not drawn)
D58  SD0805S040S0R5  [DIOC2012X06N - signal]  (value not drawn)
D59  SD0805S040S0R5  [DIOC2012X06N - signal]  (value not drawn)
D60  SD0805S040S0R5  [DIOC2012X06N - signal]  (value not drawn)
D61  SD0805S040S0R5  [DIOC2012X06N - signal]  (value not drawn)
D62  SD0805S040S0R5  [DIOC2012X06N - signal]  (value not drawn)
D63  SD0805S040S0R5  [DIOC2012X06N - signal]  (value not drawn)
D64  SD0805S040S0R5  [DIOC2012X06N - signal]  (value not drawn)
D65  SD0805S040S0R5  [DIOC2012X06N - signal]  (value not drawn)
D66  SD0805S040S0R5  [DIOC2012X06N - signal]  (value not drawn)
D68  SD0805S040S0R5  [DIOC2012X06N - signal]  (value not drawn)
D70  SD0805S040S0R5  [DIOC2012X06N - signal]  (value not drawn)
D72  SD0805S040S0R5  [DIOC2012X06N - signal]  (value not drawn)
D74  SD0805S040S0R5  [DIOC2012X06N - signal]  (value not drawn)
D75  SD0805S040S0R5  [DIOC2012X06N - signal]  (value not drawn)
D77  SD0805S040S0R5  [DIOC2012X06N - signal]  (value not drawn)
D78  SD0805S040S0R5  [DIOC2012X06N - signal]  (value not drawn)
D79  SD0805S040S0R5  [DIOC2012X06N - signal]  (value not drawn)
SW1  MX1A-11GW  [MX1A-1-LED-Pins]  (value not drawn)  (part A of 2)
SW2  MX1A-11GW  [MX1A-1-LED-Pins]  (value not drawn)  (part A of 2)
SW3  MX1A-11GW  [MX1A-1-LED-Pins]  (value not drawn)  (part A of 2)
SW4  MX1A-11GW  [MX1A-1-LED-Pins]  (value not drawn)  (part A of 2)
SW5  MX1A-11GW  [MX1A-1-LED-Pins]  (value not drawn)  (part A of 2)
SW6  MX1A-11GW  [MX1A-1-LED-Pins]  (value not drawn)  (part A of 2)
SW7  MX1A-11GW  [MX1A-1-LED-Pins]  (value not drawn)  (part A of 2)
SW8  MX1A-11GW  [MX1A-1-LED-Pins]  (value not drawn)  (part A of 2)
SW9  MX1A-11GW  [MX1A-1-LED-Pins]  (value not drawn)  (part A of 2)
SW10  MX1A-11GW  [MX1A-1-LED-Pins]  (value not drawn)  (part A of 2)
SW11  MX1A-11GW  [MX1A-1-LED-Pins]  (value not drawn)  (part A of 2)
SW12  MX1A-11GW  [MX1A-1-LED-Pins]  (value not drawn)  (part A of 2)
SW13  MX1A-11GW  [MX1A-1-LED-Pins]  (value not drawn)  (part A of 2)
SW14  MX1A-11GW  [MX1A-1-LED-Pins]  (value not drawn)  (part A of 2)
SW15  MX1A-11GW  [MX1A-1-LED-Pins]  (value not drawn)  (part A of 2)
SW16  MX1A-11GW  [MX1A-1-LED-Pins]  (value not drawn)  (part A of 2)
SW17  MX1A-11GW  [MX1A-1-LED-Pins]  (value not drawn)  (part A of 2)
SW18  MX1A-11GW  [MX1A-1-LED-Pins]  (value not drawn)  (part A of 2)
SW19  MX1A-11GW  [MX1A-1-LED-Pins]  (value not drawn)  (part A of 2)
SW20  MX1A-11GW  [MX1A-1-LED-Pins]  (value not drawn)  (part A of 2)
SW21  MX1A-11GW  [MX1A-1-LED-Pins]  (value not drawn)  (part A of 2)
SW22  MX1A-11GW  [MX1A-1-LED-Pins]  (value not drawn)  (part A of 2)
SW23  MX1A-11GW  [MX1A-1-LED-Pins]  (value not drawn)  (part A of 2)
SW24  MX1A-11GW  [MX1A-1-LED-Pins]  (value not drawn)  (part A of 2)
SW25  MX1A-11GW  [MX1A-1-LED-Pins]  (value not drawn)  (part A of 2)
SW26  MX1A-11GW  [MX1A-1-LED-Pins]  (value not drawn)  (part A of 2)
SW27  MX1A-11GW  [MX1A-1-LED-Pins]  (value not drawn)  (part A of 2)
SW28  MX1A-11GW  [MX1A-1-LED-Pins]  (value not drawn)  (part A of 2)
SW29  MX1A-11GW  [MX1A-1-LED-Pins]  (value not drawn)  (part A of 2)
SW30  MX1A-11GW  [MX1A-1-LED-Pins]  (value not drawn)  (part A of 2)
SW31  MX1A-11GW  [MX1A-1-LED-Pins]  (value not drawn)  (part A of 2)
SW32  MX1A-11GW  [MX1A-1-LED-Pins]  (value not drawn)  (part A of 2)
SW33  MX1A-11GW  [MX1A-1-LED-Pins]  (value not drawn)  (part A of 2)
SW34  MX1A-11GW  [MX1A-1-LED-Pins]  (value not drawn)  (part A of 2)
SW35  MX1A-11GW  [MX1A-1-LED-Pins]  (value not drawn)  (part A of 2)
SW36  MX1A-11GW  [MX1A-1-LED-Pins]  (value not drawn)  (part A of 2)
SW37  MX1A-11GW  [MX1A-1-LED-Pins]  (value not drawn)  (part A of 2)
SW38  MX1A-11GW  [MX1A-1-LED-Pins]  (value not drawn)  (part A of 2)
SW39  MX1A-11GW  [MX1A-1-LED-Pins]  (value not drawn)  (part A of 2)
SW40  MX1A-11GW  [MX1A-1-LED-Pins]  (value not drawn)  (part A of 2)
SW41  MX1A-11GW  [MX1A-1-LED-Pins]  (value not drawn)  (part A of 2)
SW42  MX1A-11GW  [MX1A-1-LED-Pins]  (value not drawn)  (part A of 2)
SW43  MX1A-11GW  [MX1A-1-LED-Pins]  (value not drawn)  (part A of 2)
SW44  MX1A-11GW  [MX1A-1-LED-Pins]  (value not drawn)  (part A of 2)
SW45  MX1A-11GW  [MX1A-1-LED-Pins]  (value not drawn)  (part A of 2)
SW46  MX1A-11GW  [MX1A-1-LED-Pins]  (value not drawn)  (part A of 2)
SW47  MX1A-11GW  [MX1A-1-LED-Pins]  (value not drawn)  (part A of 2)
SW48  MX1A-11GW  [MX1A-1-LED-Pins]  (value not drawn)  (part A of 2)
SW49  MX1A-11GW  [MX1A-1-LED-Pins]  (value not drawn)  (part A of 2)
SW50  MX1A-11GW  [MX1A-1-LED-Pins]  (value not drawn)  (part A of 2)
SW51  MX1A-11GW  [MX1A-1-LED-Pins]  (value not drawn)  (part A of 2)
SW52  MX1A-11GW  [MX1A-1-LED-Pins]  (value not drawn)  (part A of 2)
SW53  MX1A-11GW  [MX1A-1-LED-Pins]  (value not drawn)  (part A of 2)
SW54  MX1A-11GW  [MX1A-1-LED-Pins]  (value not drawn)  (part A of 2)
SW55  MX1A-11GW  [MX1A-1-LED-Pins]  (value not drawn)  (part A of 2)
SW56  MX1A-11GW  [MX1A-1-LED-Pins]  (value not drawn)  (part A of 2)
SW57  MX1A-11GW  [MX1A-1-LED-Pins]  (value not drawn)  (part A of 2)
SW58  MX1A-11GW  [MX1A-1-LED-Pins]  (value not drawn)  (part A of 2)
SW59  MX1A-11GW  [MX1A-1-LED-Pins]  (value not drawn)  (part A of 2)
SW60  MX1A-11GW  [MX1A-1-LED-Pins]  (value not drawn)  (part A of 2)
SW61  MX1A-11GW  [MX1A-1-LED-Pins]  (value not drawn)  (part A of 2)
SW62  MX1A-11GW  [MX1A-1-LED-Pins]  (value not drawn)  (part A of 2)
SW63  MX1A-11GW  [MX1A-1-LED-Pins]  (value not drawn)  (part A of 2)
SW64  MX1A-11GW  [MX1A-1-LED-Pins]  (value not drawn)  (part A of 2)
SW65  MX1A-11GW  [MX1A-1-LED-Pins]  (value not drawn)  (part A of 2)
SW66  MX1A-11GW  [MX1A-1-LED-Pins]  (value not drawn)  (part A of 2)
SW67  MX1A-11GW  [MX1A-1-reversed LED-Pins]  (value not drawn)  (part A of 2)
SW68  MX1A-11GW  [MX1A-1-LED-Pins]  (value not drawn)  (part A of 2)
SW69  MX1A-11GW  [MX1A-1-reversed LED-Pins]  (value not drawn)  (part A of 2)
SW70  MX1A-11GW  [MX1A-1-LED-Pins]  (value not drawn)  (part A of 2)
SW71  MX1A-11GW  [MX1A-1-reversed LED-Pins]  (value not drawn)  (part A of 2)
SW72  MX1A-11GW  [MX1A-1-LED-Pins]  (value not drawn)  (part A of 2)
SW73  MX1A-11GW  [MX1A-1-LED-Pins]  (value not drawn)  (part A of 2)
SW74  MX1A-11GW  [MX1A-1-LED-Pins]  (value not drawn)  (part A of 2)
SW75  MX1A-11GW  [MX1A-1-LED-Pins]  (value not drawn)  (part A of 2)
SW76  MX1A-11GW  [MX1A-1-reversed LED-Pins]  (value not drawn)  (part A of 2)
SW77  MX1A-11GW  [MX1A-1-LED-Pins]  (value not drawn)  (part A of 2)
SW78  MX1A-11GW  [MX1A-1-LED-Pins]  (value not drawn)  (part A of 2)
SW79  MX1A-11GW  [MX1A-1-LED-Pins]  (value not drawn)  (part A of 2)
TB*?#3  PageContents: SWITCHES 1/2  Licence: CLOSED SOURCE  Size: A3  (hidden comment: TBL TitleBlock 01)  (graphical)

### Ports
MTRX_C0 (in, see 3), MTRX_C1 (in, see 3), MTRX_C2 (in, see 3), MTRX_C3 (in, see 3), MTRX_C4 (in, see 3), MTRX_C5 (in, see 3), MTRX_C6 (in, see 3), MTRX_C7 (in, see 3), MTRX_C8 (in, see 3), MTRX_C9 (in, see 3), MTRX_C10 (in, see 3), MTRX_C11 (in, see 3), MTRX_C12 (in, see 3), MTRX_C13 (in, see 3), MTRX_C14 (in, see 3), MTRX_R0 (out, see 3), MTRX_R1 (out, see 3), MTRX_R2 (out, see 3), MTRX_R3 (out, see 3), MTRX_R4 (out, see 3)

### Nets
MTRX_C0: SW1.2(N.O.) SW18.2(N.O.) SW33.2(N.O.) SW34.2(N.O.) SW50.2(N.O.) SW51.2(N.O.) SW66.2(N.O.) SW67.2(N.O.) ; port MTRX_C0
MTRX_C1: SW2.2(N.O.) SW19.2(N.O.) SW35.2(N.O.) SW52.2(N.O.) SW68.2(N.O.) SW69.2(N.O.) ; port MTRX_C1
MTRX_C2: SW3.2(N.O.) SW20.2(N.O.) SW36.2(N.O.) SW53.2(N.O.) SW70.2(N.O.) SW71.2(N.O.) ; port MTRX_C2
MTRX_C3: SW4.2(N.O.) SW21.2(N.O.) SW37.2(N.O.) SW54.2(N.O.) ; port MTRX_C3
MTRX_C4: SW5.2(N.O.) SW22.2(N.O.) SW38.2(N.O.) SW55.2(N.O.) ; port MTRX_C4
MTRX_C5: SW6.2(N.O.) SW23.2(N.O.) SW39.2(N.O.) SW56.2(N.O.) ; port MTRX_C5
MTRX_C6: SW7.2(N.O.) SW24.2(N.O.) SW40.2(N.O.) SW57.2(N.O.) SW72.2(N.O.) SW73.2(N.O.) ; port MTRX_C6
MTRX_C7: SW8.2(N.O.) SW25.2(N.O.) SW41.2(N.O.) SW58.2(N.O.) ; port MTRX_C7
MTRX_C8: SW9.2(N.O.) SW26.2(N.O.) SW42.2(N.O.) SW59.2(N.O.) ; port MTRX_C8
MTRX_C9: SW10.2(N.O.) SW27.2(N.O.) SW43.2(N.O.) SW60.2(N.O.) ; port MTRX_C9
MTRX_C10: SW11.2(N.O.) SW28.2(N.O.) SW44.2(N.O.) SW61.2(N.O.) SW74.2(N.O.) ; port MTRX_C10
MTRX_C11: SW12.2(N.O.) SW29.2(N.O.) SW45.2(N.O.) SW62.2(N.O.) SW75.2(N.O.) SW76.2(N.O.) ; port MTRX_C11
MTRX_C12: SW13.2(N.O.) SW30.2(N.O.) SW46.2(N.O.) SW47.2(N.O.) SW63.2(N.O.) SW77.2(N.O.) ; port MTRX_C12
MTRX_C13: SW14.2(N.O.) SW15.2(N.O.) SW16.2(N.O.) SW31.2(N.O.) SW48.2(N.O.) SW64.2(N.O.) SW78.2(N.O.) ; port MTRX_C13
MTRX_C14: SW17.2(N.O.) SW32.2(N.O.) SW49.2(N.O.) SW65.2(N.O.) SW79.2(N.O.) ; port MTRX_C14
MTRX_R0: D1.1(K) D2.1(K) D3.1(K) D4.1(K) D5.1(K) D6.1(K) D7.1(K) D8.1(K) D9.1(K) D10.1(K) D11.1(K) D12.1(K) D13.1(K) D14.1(K) D17.1(K) ; port MTRX_R0
MTRX_R1: D16.1(K) D18.1(K) D19.1(K) D20.1(K) D21.1(K) D22.1(K) D23.1(K) D24.1(K) D25.1(K) D26.1(K) D27.1(K) D28.1(K) D29.1(K) D30.1(K) D32.1(K) ; port MTRX_R1
MTRX_R2: D33.1(K) D35.1(K) D36.1(K) D37.1(K) D38.1(K) D39.1(K) D40.1(K) D41.1(K) D42.1(K) D43.1(K) D44.1(K) D45.1(K) D46.1(K) D48.1(K) D49.1(K) ; port MTRX_R2
MTRX_R3: D50.1(K) D52.1(K) D53.1(K) D54.1(K) D55.1(K) D56.1(K) D57.1(K) D58.1(K) D59.1(K) D60.1(K) D61.1(K) D62.1(K) D63.1(K) D64.1(K) D65.1(K) ; port MTRX_R3
MTRX_R4: D66.1(K) D68.1(K) D70.1(K) D72.1(K) D74.1(K) D75.1(K) D77.1(K) D78.1(K) D79.1(K) ; port MTRX_R4
NetD1_2: D1.2(A) SW1.1(COM)
NetD2_2: D2.2(A) SW2.1(COM)
NetD3_2: D3.2(A) SW3.1(COM)
NetD4_2: D4.2(A) SW4.1(COM)
NetD5_2: D5.2(A) SW5.1(COM)
NetD6_2: D6.2(A) SW6.1(COM)
NetD7_2: D7.2(A) SW7.1(COM)
NetD8_2: D8.2(A) SW8.1(COM)
NetD9_2: D9.2(A) SW9.1(COM)
NetD10_2: D10.2(A) SW10.1(COM)
NetD11_2: D11.2(A) SW11.1(COM)
NetD12_2: D12.2(A) SW12.1(COM)
NetD13_2: D13.2(A) SW13.1(COM)
NetD14_2: D14.2(A) SW14.1(COM) SW15.1(COM)
NetD16_2: D16.2(A) SW16.1(COM)
NetD17_2: D17.2(A) SW17.1(COM)
NetD18_2: D18.2(A) SW18.1(COM)
NetD19_2: D19.2(A) SW19.1(COM)
NetD20_2: D20.2(A) SW20.1(COM)
NetD21_2: D21.2(A) SW21.1(COM)
NetD22_2: D22.2(A) SW22.1(COM)
NetD23_2: D23.2(A) SW23.1(COM)
NetD24_2: D24.2(A) SW24.1(COM)
NetD25_2: D25.2(A) SW25.1(COM)
NetD26_2: D26.2(A) SW26.1(COM)
NetD27_2: D27.2(A) SW27.1(COM)
NetD28_2: D28.2(A) SW28.1(COM)
NetD29_2: D29.2(A) SW29.1(COM)
NetD30_2: D30.2(A) SW30.1(COM)
NetD32_2: D32.2(A) SW32.1(COM)
NetD33_2: D33.2(A) SW33.1(COM) SW34.1(COM)
NetD35_2: D35.2(A) SW35.1(COM)
NetD36_2: D36.2(A) SW36.1(COM)
NetD37_2: D37.2(A) SW37.1(COM)
NetD38_2: D38.2(A) SW38.1(COM)
NetD39_2: D39.2(A) SW39.1(COM)
NetD40_2: D40.2(A) SW40.1(COM)
NetD41_2: D41.2(A) SW41.1(COM)
NetD42_2: D42.2(A) SW42.1(COM)
NetD43_2: D43.2(A) SW43.1(COM)
NetD44_2: D44.2(A) SW44.1(COM)
NetD45_2: D45.2(A) SW45.1(COM)
NetD46_2: D46.2(A) SW46.1(COM) SW47.1(COM)
NetD48_2: D48.2(A) SW31.1(COM) SW48.1(COM)
NetD49_2: D49.2(A) SW49.1(COM)
NetD50_2: D50.2(A) SW50.1(COM) SW51.1(COM)
NetD52_2: D52.2(A) SW52.1(COM)
NetD53_2: D53.2(A) SW53.1(COM)
NetD54_2: D54.2(A) SW54.1(COM)
NetD55_2: D55.2(A) SW55.1(COM)
NetD56_2: D56.2(A) SW56.1(COM)
NetD57_2: D57.2(A) SW57.1(COM)
NetD58_2: D58.2(A) SW58.1(COM)
NetD59_2: D59.2(A) SW59.1(COM)
NetD60_2: D60.2(A) SW60.1(COM)
NetD61_2: D61.2(A) SW61.1(COM)
NetD62_2: D62.2(A) SW62.1(COM)
NetD63_2: D63.2(A) SW63.1(COM)
NetD64_2: D64.2(A) SW64.1(COM)
NetD65_2: D65.2(A) SW65.1(COM)
NetD66_2: D66.2(A) SW66.1(COM) SW67.1(COM)
NetD68_2: D68.2(A) SW68.1(COM) SW69.1(COM)
NetD70_2: D70.2(A) SW70.1(COM) SW71.1(COM)
NetD72_2: D72.2(A) SW72.1(COM) SW73.1(COM)
NetD74_2: D74.2(A) SW74.1(COM)
NetD75_2: D75.2(A) SW75.1(COM) SW76.1(COM)
NetD77_2: D77.2(A) SW77.1(COM)
NetD78_2: D78.2(A) SW78.1(COM)
NetD79_2: D79.2(A) SW79.1(COM)

### Notes on the sheet
- MX SWITCHES
- Matrix of MX Switches.
  Switches supports backlight LEDs - located on the "s06 [LEDs]".
  Switches with the footprint “MX1A-1-reversed LED-Pins”: SW67, SW69, SW71 and SW76.
  Switches with the footprint “MX1A-1-LED-Pins”: all others.
  For switch pairs SW14/SW15, SW46/SW47, SW48/SW31, SW50/SW51, SW66/SW67, SW68/SW69, SW70/SW71, SW72/SW73, SW75/SW76 only one switch/LED is used -> same resistor and same diode.
- COL0
- COL1
- COL2
- COL3
- COL4
- COL5
- COL6
- COL7
- COL8
- COL9
- COL10
- COL11
- COL12
- COL13
- COL14
- ROW0
- ROW1
- ROW2
- ROW3
- ROW4
- (in symbol TBL TitleBlock 01) Project:; Rev:; Variant:; Page Contents:; Size:; Author:; Date:; Sheet; of

### Library data of the parts
D1-D14 D16-D30 D32 D33 D35-D46 D48-D50 D52-D66 D68 D70 D72 D74 D75 D77-D79 = SEM SCH 40V 0.5A 0805 SD0805S040S0R5: Schottky Diode, Small Signal, Single, 40 V, 500 mA, 480 mV, 5A max.; Manufacturer: Kyocera AVX; Forward Current: 500mA; Max Reverse Current: 100uA; Forward Voltage: 480mV; Max Repetitive Reverse Voltage (Vrrm): 40V; Supplier 1: Digi-Key; Manufacturer Part Number: SD0805S040S0R5; Stock 1: 50780; Pricing 1: 1 = 0,47000, 10 = 0,35600, 100 = 0,22150, 500 = 0,15158, 1000 = 0,11660 (USD); RoHS: Yes; Mount: Surface Mount; Number of Pins: 2; Case Code (Metric): 2012; Case Code (Imperial): 0805; Min Operating Temperature: -55°C; Max Operating Temperature: 125°C; Max Surge Current: 5A; Packaging: Tape and Reel; Package Quantity: 3000; Average Rectified Current: 500mA; Max Reverse Leakage Current: 100uA; Peak Non-Repetitive Surge Current: 5A; Max Forward Surge Current (Ifsm): 5A; Element Configuration: Single; Max Reverse Voltage (DC): 40V; Series: -; Radiation Hardening: No; REACH SVHC: No SVHC; RoHS Compliant: Yes; ComponentLink1URL: https://datasheet.ciiva.com/46411/1796790-46411381.pdf?src-supplier=Element14; ComponentLink1Description: https://datasheet.ciiva.com/46411/1796790-46411381.pdf?src-supplier=Element14; ComponentLink2URL: https://datasheet.ciiva.com/6377/schottky-6377002.pdf?src-supplier=Digi-Key; ComponentLink2Description: https://datasheet.ciiva.com/6377/schottky-6377002.pdf?src-supplier=Digi-Key; ComponentLink3URL: https://datasheet.ciiva.com/6377/schottky-6377003.pdf?src-supplier=Digi-Key; ComponentLink3Description: https://datasheet.ciiva.com/6377/schottky-6377003.pdf?src-supplier=Digi-Key; Supplier Part Number 1: 478-7802-1-ND; Case/Package: 0805
SW1-SW79 = SW MX1A-11GW: Cherry MX switch, 1-pole w/LED, w/fixation pins, GREEN LED; Supplier 1: Digi-Key; Manufacturer: Cherry; Manufacturer Part Number: MX1A-11GW; Stock 1: 0; Pricing 1: 8000 = 1,62196 (USD); RoHS: No; Supplier Part Number 1: MX1A-11GW-ND
TB*?#3 = TBL TitleBlock 01: Custom Title block

## Sheet MONO65_A2_s05 [Switches-2].SchDoc
size A3; DocumentNumber: 5; SheetNumber: 5; SheetTotal: 7
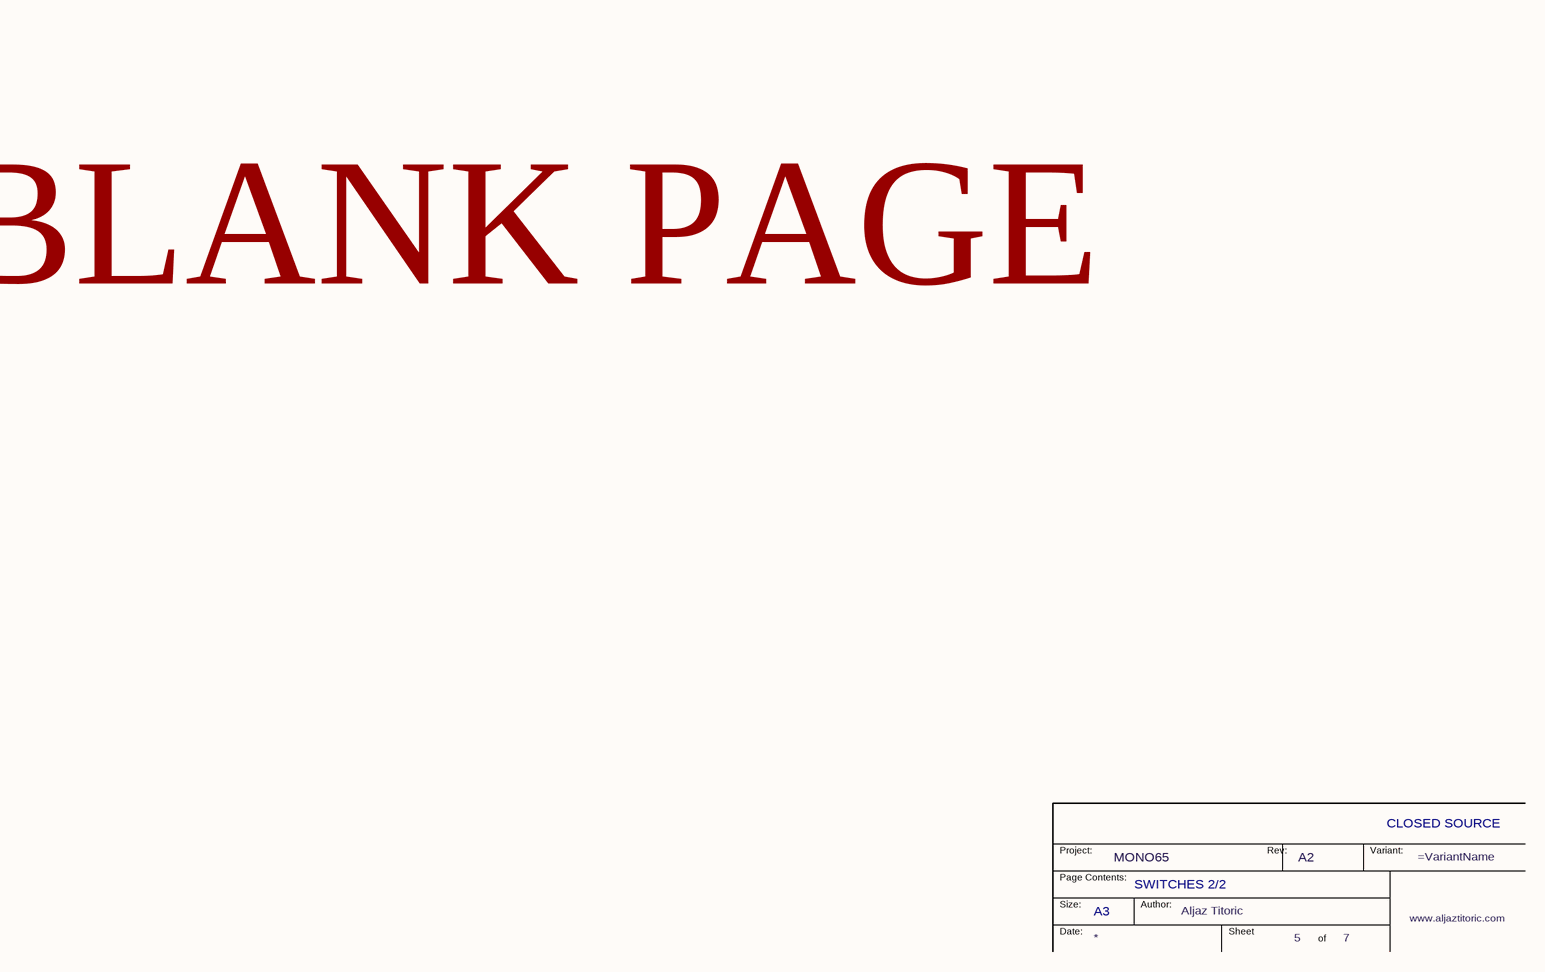
[diagram p4: MONO65_A2_s05 [Switches-2].SchDoc]

### Parts
(Parts that share a designator on the sheet are numbered #1, #2 ... from top to bottom, then left to right.)
TB*?#4  PageContents: SWITCHES 2/2  Licence: CLOSED SOURCE  Size: A3  (hidden comment: TBL TitleBlock 01)  (graphical)

### Notes on the sheet
- BLANK PAGE
- (in symbol TBL TitleBlock 01) Project:; Rev:; Variant:; Page Contents:; Size:; Author:; Date:; Sheet; of

### Library data of the parts
TB*?#4 = TBL TitleBlock 01: Custom Title block